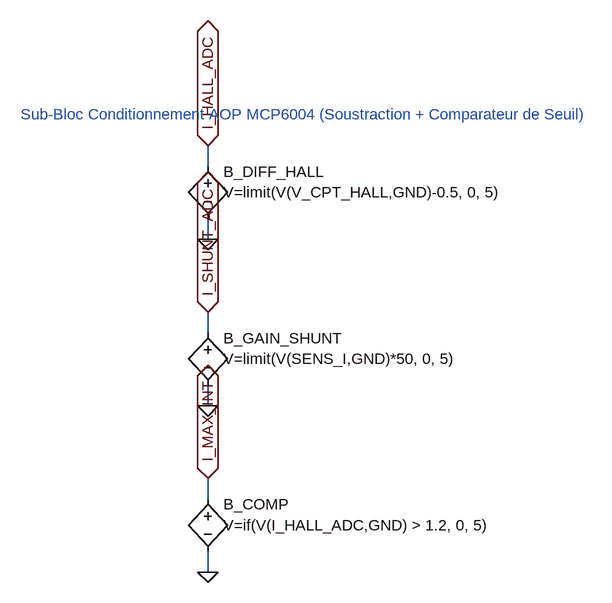
[diagram p0: schematic sub_conditionnement.asc]
sub_conditionnement.asc, the LTspice schematic file:
Version 4
SHEET 1 3200 2400
TEXT 32 32 Left 2 ;Sub-Bloc Conditionnement AOP MCP6004 (Soustraction + Comparateur de Seuil)
SYMBOL bv 320 96 R0
WINDOW 0 24 24 Left 2
WINDOW 3 24 56 Left 2
SYMATTR InstName B_DIFF_HALL
SYMATTR Value V=limit(V(V_CPT_HALL,GND)-0.5, 0, 5)
WIRE 320 112 320 80
FLAG 320 80 I_HALL_ADC
IOPIN 320 80 BiDir
WIRE 320 192 320 224
FLAG 320 224 0
IOPIN 320 224 BiDir
SYMBOL bv 320 352 R0
WINDOW 0 24 24 Left 2
WINDOW 3 24 56 Left 2
SYMATTR InstName B_GAIN_SHUNT
SYMATTR Value V=limit(V(SENS_I,GND)*50, 0, 5)
WIRE 320 368 320 336
FLAG 320 336 I_SHUNT_ADC
IOPIN 320 336 BiDir
WIRE 320 448 320 480
FLAG 320 480 0
IOPIN 320 480 BiDir
SYMBOL bv 320 608 R0
WINDOW 0 24 24 Left 2
WINDOW 3 24 56 Left 2
SYMATTR InstName B_COMP
SYMATTR Value V=if(V(I_HALL_ADC,GND) > 1.2, 0, 5)
WIRE 320 624 320 592
FLAG 320 592 I_MAX_INT
IOPIN 320 592 BiDir
WIRE 320 704 320 736
FLAG 320 736 0
IOPIN 320 736 BiDir

The netlist it stands for:
* sub_conditionnement.asc
B_DIFF_HALL I_HALL_ADC 0 V=limit(V(V_CPT_HALL,GND)-0.5, 0, 5)
B_GAIN_SHUNT I_SHUNT_ADC 0 V=limit(V(SENS_I,GND)*50, 0, 5)
B_COMP I_MAX_INT 0 V=if(V(I_HALL_ADC,GND) > 1.2, 0, 5)
* Sub-Bloc Conditionnement AOP MCP6004 (Soustraction + Comparateur de Seuil)
.backanno
.end